# Altium project Main_Board.PrjPcb (part 1 of 44)
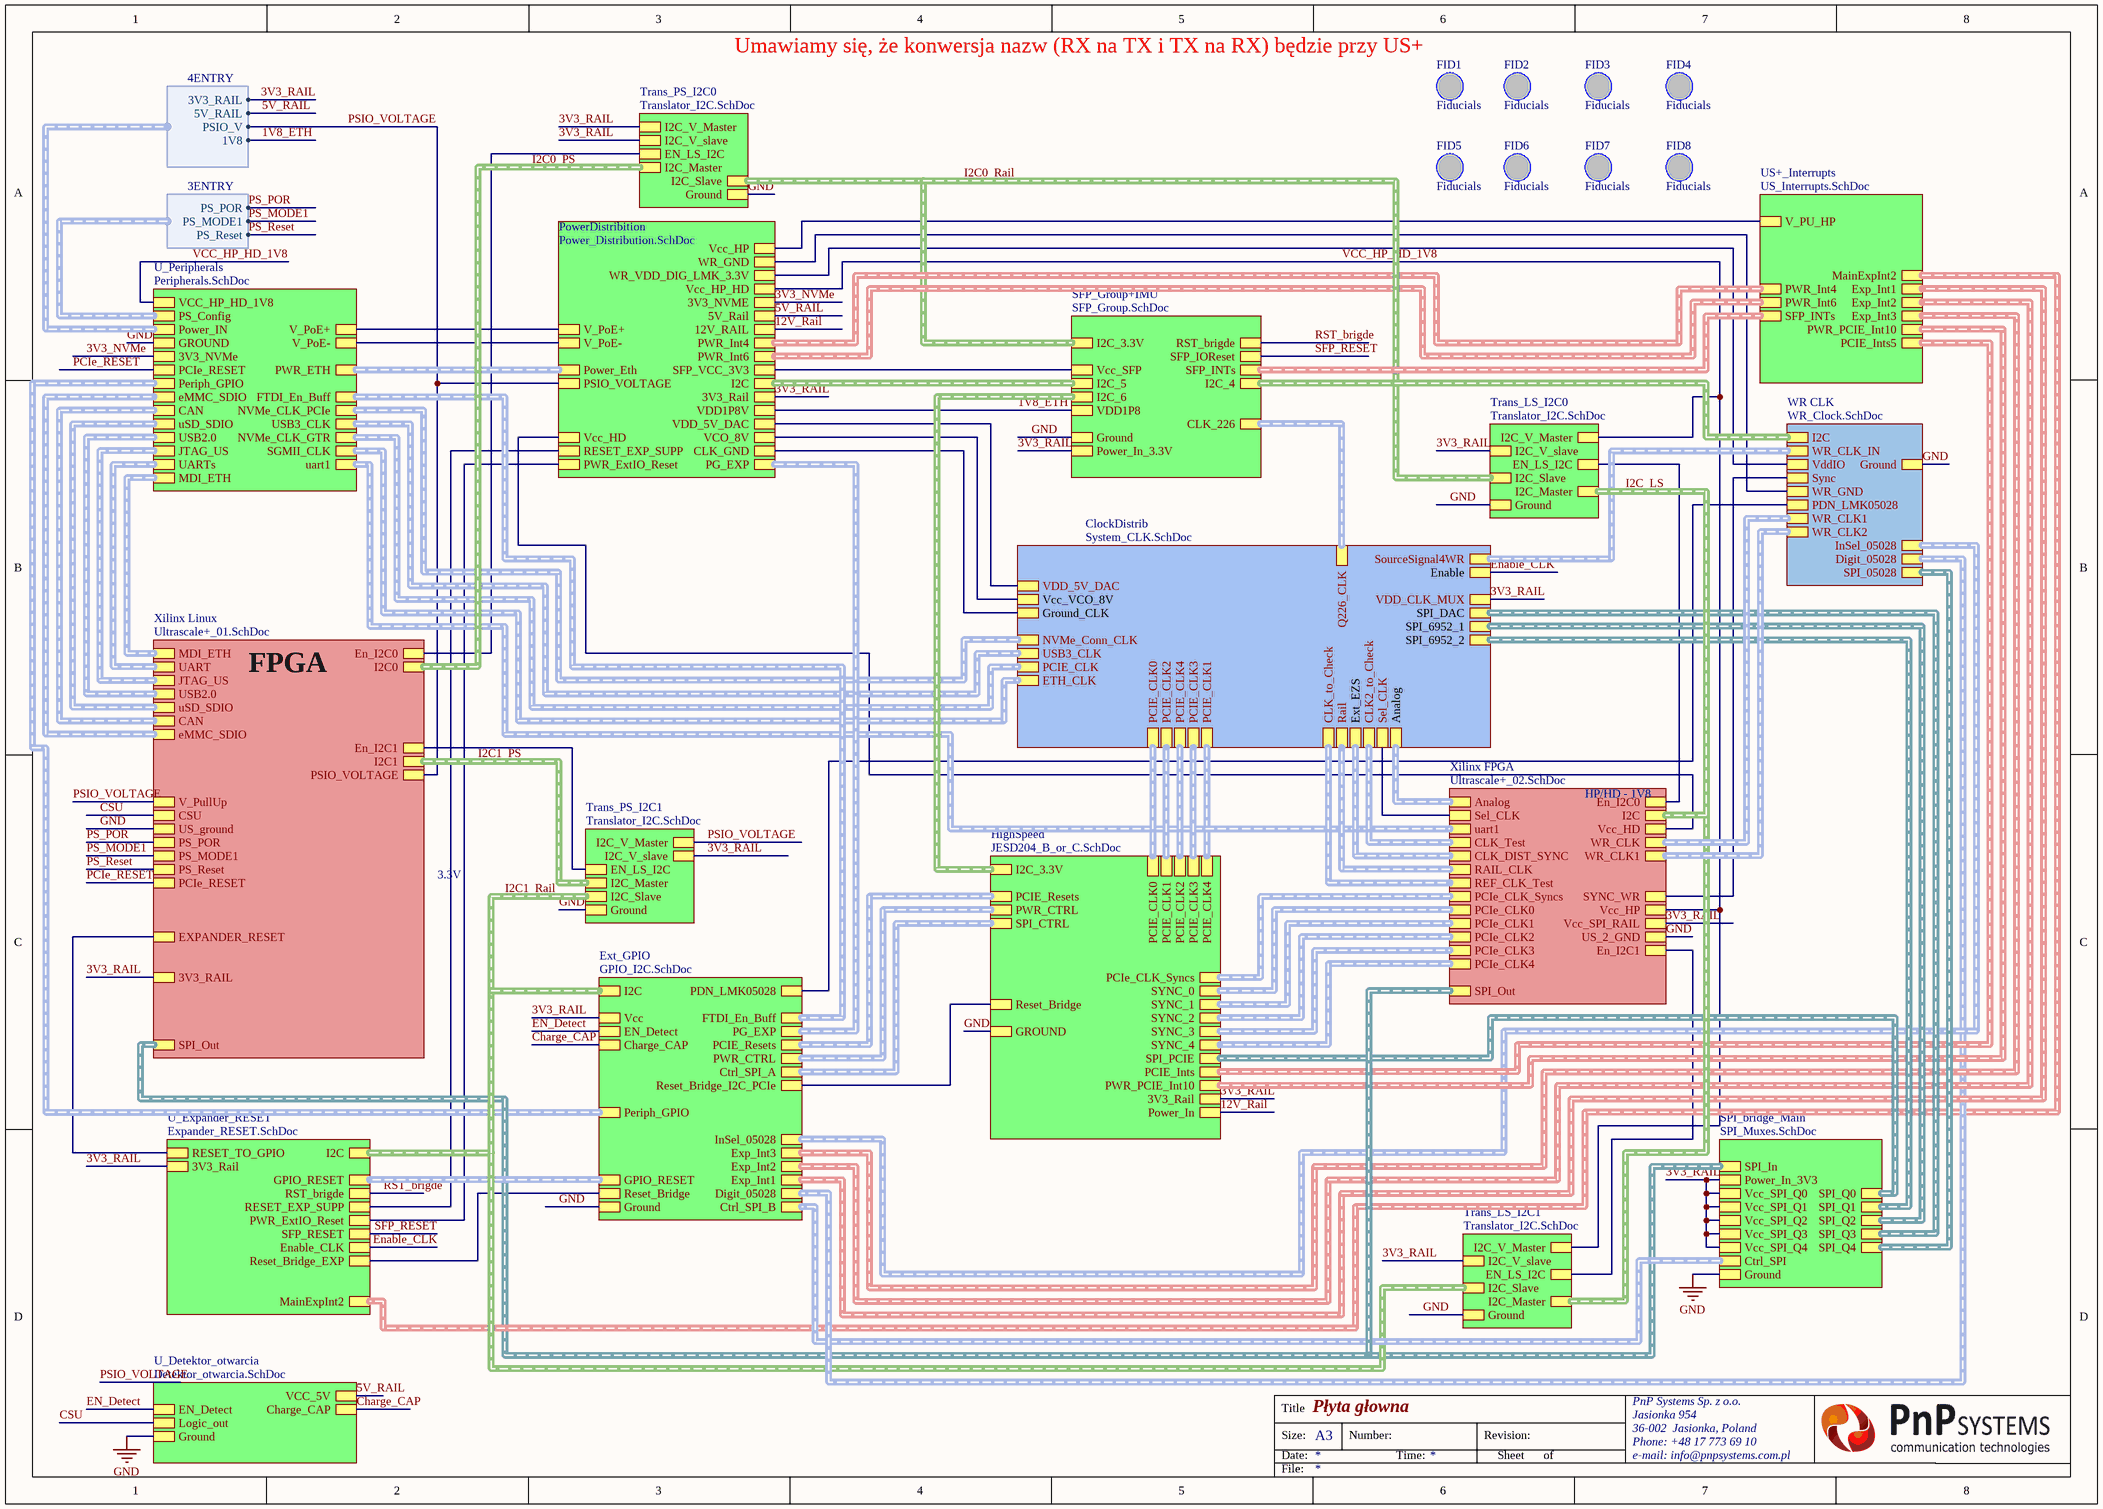
[diagram p0: Main_Board.SchDoc]
Address10: Jasionka 954; Address20: 36-002  Jasionka, Poland; Address30: Phone: +48 17 773 69 10; Address40: e-mail: info@pnpsystems.com.pl; CompanyName1: PnP Systems Sp. z o.o.
70 sheets, 2644 parts. Net scope: hierarchical (ports join the sheet entries above them; power ports are global).
Board file: MainBoardPCB.PcbDoc
Sheets:
  Main_Board.SchDoc
    Xilinx Linux = Ultrascale+_01.SchDoc
      PS_Config = PS_Config.SchDoc
      U_LED_US_1 = LED_US_1.SchDoc
    WR CLK = WR_Clock.SchDoc
    ClockDistrib = System_CLK.SchDoc
      DAC = DAC.SchDoc
      CLK_MUX = CLK_Mux.SchDoc
      LTC6952_1 = LTC6952_1.SchDoc
      LTC6952_0 = LTC6952.SchDoc
    Xilinx FPGA = Ultrascale+_02.SchDoc
    HighSpeed = JESD204_B_or_C.SchDoc
      PCIE0 = PCIe.SchDoc
      PCIE1 = PCIe.SchDoc
      PCIE2 = PCIe.SchDoc
      PCIE3 = PCIe.SchDoc
      PCIE4 = PCIe.SchDoc
      Bank 224 = Bank224.SchDoc
      Bank 225 = Bank225.SchDoc
      Bank 223 = Bank223.SchDoc
      I2C_Bridge_PCIE = I2C_Bridge.SchDoc
      SPI_bridge_PCIe = SPI_Muxes.SchDoc
      Power4HighSpeed = Power4HiSpeed.SchDoc
        U_Pomiar_pradu_napiecia_PCIe0 = Pomiar_pradu_napiecia.SchDoc
        U_Pomiar_pradu_napiecia_PCIe1 = Pomiar_pradu_napiecia.SchDoc
        U_Pomiar_pradu_napiecia_PCIe2 = Pomiar_pradu_napiecia.SchDoc
        U_Pomiar_pradu_napiecia_PCIe3 = Pomiar_pradu_napiecia.SchDoc
        U_Pomiar_pradu_napiecia_PCIe4 = Pomiar_pradu_napiecia.SchDoc
    PowerDistribition = Power_Distribution.SchDoc
      PowerSelector = Power_Switch.SchDoc
      HiCurrent = Power_Hi_Curr.SchDoc
        U_HI_Curr_ADP1850_1 = HI_Curr_ADP1850.SchDoc
        U_HI_Curr_ADP1850_3 = Power_ADP1850_Dual.SchDoc
        U_Power_ADP1850_Dual_2 = Power_ADP1850_Dual_1.SchDoc
        U_Pomiar_pradu_napiecia_3 = Pomiar_pradu_napiecia.SchDoc
        U_Pomiar_pradu_napiecia_4 = Pomiar_pradu_napiecia.SchDoc
        U_Pomiar_pradu_napiecia_5 = Pomiar_pradu_napiecia.SchDoc
        U_Pomiar_pradu_napiecia_6 = Pomiar_pradu_napiecia.SchDoc
        U_Pomiar_napiecia_high_curr = Pomiar_napiecia_high_curr.SchDoc
      LowCurr = Power_Low_Curr.SchDoc
      Zasilanie CLK = Zasilanie_CLKDistribution.SchDoc
        U_ADP1741_3 = ADP1741_3.6V_3.3V@2A.SchDoc
        5to3V3_1 = 5V_to_3V3.SchDoc
        5to3V3_2 = 5V_to_3V3.SchDoc
        U_LT3042_12V_5V_LNLDO = LT3042_12V_5V_LNLDO.SchDoc
        U_TPS7A88_5V_Dual_3 = TPS7A88_5V_Dual_3.3V_3.3V.SchDoc
        I2C_Expander_PWR_CLK = I2C_Expander.SchDoc
      Ram_Power = RAM_Power.SchDoc
      XilinxPower = XilinxPower.SchDoc
        U_FPGA_Decoupling = FPGA_Decoupling.SchDoc
      Ram = RAM.SchDoc
      GND = Ground.SchDoc
      U_Power_Ethernet = Power_Ethernet.SchDoc
      I2C_Expander_PWR_Dist = I2C_Expander.SchDoc
      U_Pomiar_pradu_napiecia_1 = Pomiar_pradu_napiecia.SchDoc
      U_Pomiar_pradu_napiecia_2 = Pomiar_pradu_napiecia.SchDoc
      U_Power_48_20V@3A = Power_48_20V@3A.SchDoc
      U_UM78M_12_8V = UM78M_12_8V.SchDoc
      U_TPS7A88_3V3_1V8_0V9V@2x1A = TPS7A88_3V3_1V8_0V9V@2x1A.SchDoc
      U_ADP1741_3V3_0V85 = ADP1741_3V3_0V85.SchDoc
      U_ST1L08_5V_0V6 = ST1L08_5V_0V6.SchDoc
      U_Power_LED = Power_LED.SchDoc
    Trans_LS_I2C0 = Translator_I2C.SchDoc
    Ext_GPIO = GPIO_I2C.SchDoc
      I2C_Bridge_GPIO = I2C_Bridge.SchDoc
      Ext_GPIO_Bank0 = Ext_GPIO_Bank0.SchDoc
        I2C_Expander_00 = I2C_Expander.SchDoc
        I2C_Expander_01 = I2C_Expander.SchDoc
        I2C_Expander_02 = I2C_Expander.SchDoc
      Ext_GPIO_Bank1 = Ext_GPIO_Bank1.SchDoc
        I2C_Expander_10 = I2C_Expander.SchDoc
        I2C_Expander_11 = I2C_Expander.SchDoc
        I2C_Expander_12 = I2C_Expander.SchDoc
      Ext_GPIO_Bank2 = Ext_GPIO_Bank2.SchDoc
    SFP_Group+IMU = SFP_Group.SchDoc
      SFP0 = SFP.SchDoc
      SFP1 = SFP1.SchDoc
      SFP2 = SFP2.SchDoc
      SFP3 = SFP3.SchDoc
      I2C_Bridge_SFP = I2C_Bridge.SchDoc
      Bank 226 = bank226.SchDoc
      IMU = IMU.SchDoc
      I2C_Expander_SFP = I2C_Expander.SchDoc
    Trans_PS_I2C0 = Translator_I2C.SchDoc
    Trans_PS_I2C1 = Translator_I2C.SchDoc
    SPI_bridge_Main = SPI_Muxes.SchDoc
    Trans_LS_I2C1 = Translator_I2C.SchDoc
    U_Detektor_otwarcia = Detektor_otwarcia.SchDoc
    U_Peripherals = Peripherals.SchDoc
      Gigabit Eth = RJ45.SchDoc
      NVMe = Sata.SchDoc
      µSD = uSD.SchDoc
      Debug = FTDI.SchDoc
        5V_to_3V3_for_FTDI = 5V_to_3V3.SchDoc
      USB3.0 = USB3.SchDoc
      U_CAN = CAN.SchDoc
      Flash_Memory = eMMC.SchDoc
      GTR = GTR.SchDoc
    U_Expander_RESET = Expander_RESET.SchDoc
      I2C_Expander_Main_Rst = I2C_Expander.SchDoc
    US+_Interrupts = US_Interrupts.SchDoc

## Sheet Main_Board.SchDoc: Płyta głowna
size A3; Organization: Altium Limited; Address1: L3, 12a Rodborough Rd; Address2: Frenchs Forest; Address3: NSW; Address4: Australia 2086

### Parts
FID1  Fiducials  [Fiducials]
FID2  Fiducials  [Fiducials]
FID3  Fiducials  [Fiducials]
FID4  Fiducials  [Fiducials]
FID5  Fiducials  [Fiducials]
FID6  Fiducials  [Fiducials]
FID7  Fiducials  [Fiducials]
FID8  Fiducials  [Fiducials]

### Sub-sheets
ClockDistrib = System_CLK.SchDoc: SPI_6952_1 (harness SPI_H), Ground_CLK, Ext_EZS (harness Diff_1Pair), Enable, Analog (harness Analog), Vcc_VCO_8V, SPI_6952_2 (harness SPI_H), SPI_DAC (harness SPI_H), Q226_CLK (harness Diff_1Pair), SourceSignal4WR (harness Diff_1Pair), Rail (harness Diff_1Pair), CLK_to_Check (harness Diff_1Pair), ETH_CLK (harness Diff_1Pair), USB3_CLK (harness Diff_1Pair), PCIE_CLK (harness Diff_1Pair), Sel_CLK, CLK2_to_Check (harness Diff_1Pair), NVMe_Conn_CLK (harness Diff_1Pair), VDD_5V_DAC, VDD_CLK_MUX, PCIE_CLK0 (harness Diff_1Pair), PCIE_CLK2 (harness Diff_1Pair), PCIE_CLK4 (harness Diff_1Pair), PCIE_CLK3 (harness Diff_1Pair), PCIE_CLK1 (harness Diff_1Pair)
Ext_GPIO = GPIO_I2C.SchDoc: Ctrl_SPI_B (harness Ctrl_SPI_PCIE), Ctrl_SPI_A (harness Ctrl_SPI_PCIE), Ground, Vcc, I2C (harness I2C), Digit_05028 (harness 05028_Digit), GPIO_RESET (harness Exp_Reset3), Reset_Bridge, PG_EXP (harness 7_PG), PDN_LMK05028, EN_Detect, Charge_CAP, Exp_Int1 (harness Exp_Int), PCIE_Resets (harness PCIe_Resets), PWR_CTRL (harness Ctrl_Pwr4HiSpeed), Periph_GPIO (harness Periph_GPIO), Exp_Int2 (harness Exp_Int), Exp_Int3 (harness Exp_Int), InSel_05028 (harness InSel_05028), FTDI_En_Buff (harness FTDI_En_Buff), Reset_Bridge_I2C_PCIe
HighSpeed = JESD204_B_or_C.SchDoc: PCIE_Resets (harness PCIe_Resets), SPI_PCIE (harness SPI_H), Power_In, SPI_CTRL (harness Ctrl_SPI_PCIE), PWR_CTRL (harness Ctrl_Pwr4HiSpeed), I2C_3.3V (harness I2C), Reset_Bridge, 3V3_Rail, PWR_PCIE_Int10 (harness PWR_PCIE_Int10), GROUND, PCIE_Ints (harness PCIe_Ints), PCIe_CLK_Syncs (harness PCIe_CLK_Syncs), SYNC_4 (harness Diff_3Diff_Pcie), SYNC_3 (harness Diff_3Diff_Pcie), SYNC_2 (harness Diff_3Diff_Pcie), SYNC_1 (harness Diff_3Diff_Pcie), SYNC_0 (harness Diff_3Diff_Pcie), PCIE_CLK4 (harness Diff_1Pair), PCIE_CLK0 (harness Diff_1Pair), PCIE_CLK3 (harness Diff_1Pair), PCIE_CLK1 (harness Diff_1Pair), PCIE_CLK2 (harness Diff_1Pair)
PowerDistribition = Power_Distribution.SchDoc: Power_Eth (harness Power_ETH), V_PoE-, V_PoE+, SFP_VCC_3V3, 3V3_Rail, I2C (harness I2C), VDD1P8V, 12V_RAIL, PWR_Int4 (harness PWR_Int4), PWR_ExtIO_Reset, 5V_Rail, PWR_Int6 (harness PWR_Interrupt), WR_VDD_DIG_LMK_3.3V, PSIO_VOLTAGE, VCO_8V, 3V3_NVME, VDD_5V_DAC, Vcc_HP_HD, WR_GND, CLK_GND, RESET_EXP_SUPP, PG_EXP (harness 7_PG), Vcc_HP, Vcc_HD
SFP_Group+IMU = SFP_Group.SchDoc: I2C_3.3V (harness I2C), RST_brigde, Ground, Vcc_SFP, SFP_INTs (harness SFP_INTs), I2C_5 (harness I2C), Power_In_3.3V, VDD1P8, SFP_IOReset, CLK_226 (harness Diff_1Pair), I2C_6 (harness I2C), I2C_4 (harness I2C)
SPI_bridge_Main = SPI_Muxes.SchDoc: SPI_Q0 (harness SPI_H), SPI_Q1 (harness SPI_H), SPI_Q2 (harness SPI_H), SPI_Q3 (harness SPI_H), SPI_Q4 (harness SPI_H), SPI_In (harness SPI_H), Power_In_3V3, Ctrl_SPI (harness Ctrl_SPI_PCIE), Vcc_SPI_Q4, Vcc_SPI_Q3, Vcc_SPI_Q2, Vcc_SPI_Q1, Vcc_SPI_Q0, Ground
Trans_LS_I2C0 = Translator_I2C.SchDoc: Ground, EN_LS_I2C, I2C_Slave (harness I2C), I2C_Master (harness I2C), I2C_V_slave, I2C_V_Master
Trans_LS_I2C1 = Translator_I2C.SchDoc: Ground, EN_LS_I2C, I2C_Slave (harness I2C), I2C_Master (harness I2C), I2C_V_slave, I2C_V_Master
Trans_PS_I2C0 = Translator_I2C.SchDoc: Ground, EN_LS_I2C, I2C_Slave (harness I2C), I2C_Master (harness I2C), I2C_V_slave, I2C_V_Master
Trans_PS_I2C1 = Translator_I2C.SchDoc: Ground, EN_LS_I2C, I2C_Slave (harness I2C), I2C_Master (harness I2C), I2C_V_slave, I2C_V_Master
U_Detektor_otwarcia = Detektor_otwarcia.SchDoc: EN_Detect, Logic_out, Ground, VCC_5V, Charge_CAP
U_Expander_RESET = Expander_RESET.SchDoc: 3V3_Rail, RESET_TO_GPIO, GPIO_RESET (harness Exp_Reset3), RESET_EXP_SUPP, PWR_ExtIO_Reset, SFP_RESET, MainExpInt2 (harness MainExpInt2), RST_brigde, Enable_CLK, Reset_Bridge_EXP, I2C (harness I2C)
U_Peripherals = Peripherals.SchDoc: 3V3_NVMe, GROUND, V_PoE+, V_PoE-, PS_Config (harness 3ENTRY), Periph_GPIO (harness Periph_GPIO), Power_IN (harness 4ENTRY), PWR_ETH (harness Power_ETH), uart1 (harness uart), UARTs (harness 2Uarts), USB2.0 (harness USB_H), MDI_ETH (harness MDI_ETH), CAN (harness CAN), uSD_SDIO (harness SDIO_H), eMMC_SDIO (harness SDIO_H), NVMe_CLK_GTR (harness Diff_1Pair), USB3_CLK (harness Diff_1Pair), SGMII_CLK (harness Diff_1Pair), JTAG_US (harness JTAG), NVMe_CLK_PCIe (harness Diff_1Pair), VCC_HP_HD_1V8, FTDI_En_Buff (harness FTDI_En_Buff), PCIe_RESET
US+_Interrupts = US_Interrupts.SchDoc: V_PU_HP, MainExpInt2 (harness MainExpInt2), PCIE_Ints5 (harness PCIe_Ints5), PWR_Int4 (harness PWR_Int4), PWR_Int6 (harness PWR_Interrupt), SFP_INTs (harness SFP_INTs), Exp_Int1 (harness Exp_Int), PWR_PCIE_Int10 (harness PWR_PCIE_Int10), Exp_Int2 (harness Exp_Int), Exp_Int3 (harness Exp_Int)
WR CLK = WR_Clock.SchDoc: WR_CLK1 (harness Diff_1Pair), WR_CLK2 (harness Diff_1Pair), Sync, VddIO, WR_CLK_IN (harness Diff_1Pair), SPI_05028 (harness SPI_H), Ground, Digit_05028 (harness 05028_Digit), I2C (harness I2C), WR_GND, PDN_LMK05028, InSel_05028 (harness InSel_05028)
Xilinx FPGA = Ultrascale+_02.SchDoc: I2C (harness I2C), SPI_Out (harness SPI_H), uart1 (harness uart), En_I2C0, WR_CLK (harness Diff_1Pair), REF_CLK_Test (harness Diff_1Pair), RAIL_CLK (harness Diff_1Pair), Analog (harness Analog), CLK_DIST_SYNC (harness Diff_1Pair), WR_CLK1 (harness Diff_1Pair), Vcc_HP, US_2_GND, Vcc_SPI_RAIL, En_I2C1, Sel_CLK, SYNC_WR, CLK_Test (harness Diff_1Pair), PCIe_CLK_Syncs (harness PCIe_CLK_Syncs), Vcc_HD, PCIe_CLK2 (harness Diff_3Diff_Pcie), PCIe_CLK4 (harness Diff_3Diff_Pcie), PCIe_CLK1 (harness Diff_3Diff_Pcie), PCIe_CLK3 (harness Diff_3Diff_Pcie), PCIe_CLK0 (harness Diff_3Diff_Pcie)
Xilinx Linux = Ultrascale+_01.SchDoc: I2C0 (harness I2C), SPI_Out (harness SPI_H), I2C1 (harness I2C), En_I2C0, En_I2C1, V_PullUp, US_ground, CSU, PSIO_VOLTAGE, PS_POR, PS_MODE1, PS_Reset, UART (harness 2Uarts), EXPANDER_RESET, MDI_ETH (harness MDI_ETH), USB2.0 (harness USB_H), eMMC_SDIO (harness SDIO_H), CAN (harness CAN), uSD_SDIO (harness SDIO_H), JTAG_US (harness JTAG), PCIe_RESET, 3V3_RAIL  | Parameter 1: FPGA

### Harnesses
4ENTRY: 3V3_RAIL, 5V_RAIL, PSIO_V, 1V8
3ENTRY: PS_POR, PS_MODE1, PS_Reset

### Nets
GND: sheet Xilinx Linux/US_ground, sheet WR CLK/Ground, sheet Xilinx FPGA/US_2_GND, sheet HighSpeed/GROUND, sheet Trans_LS_I2C0/Ground, sheet Ext_GPIO/Ground, sheet SFP_Group+IMU/Ground, sheet Trans_PS_I2C0/Ground, sheet Trans_PS_I2C1/Ground, sheet SPI_bridge_Main/Ground, sheet Trans_LS_I2C1/Ground, sheet U_Detektor_otwarcia/Ground, sheet U_Peripherals/GROUND  [project net B503_Ground]
1V8_ETH: sheet PowerDistribition/VDD1P8V, sheet SFP_Group+IMU/VDD1P8, sheet U_Peripherals/Power_IN.1V8  [project net 1V8@1.5A]
3V3_NVMe: sheet PowerDistribition/3V3_NVME, sheet U_Peripherals/3V3_NVMe
3V3_RAIL: sheet Xilinx Linux/3V3_RAIL, sheet ClockDistrib/VDD_CLK_MUX, sheet Xilinx FPGA/Vcc_SPI_RAIL, sheet HighSpeed/3V3_Rail, sheet PowerDistribition/SFP_VCC_3V3, sheet PowerDistribition/3V3_Rail, sheet Trans_LS_I2C0/I2C_V_slave, sheet Ext_GPIO/Vcc, sheet SFP_Group+IMU/Vcc_SFP, sheet SFP_Group+IMU/Power_In_3.3V, sheet Trans_PS_I2C0/I2C_V_slave, sheet Trans_PS_I2C0/I2C_V_Master, sheet Trans_PS_I2C1/I2C_V_slave, sheet SPI_bridge_Main/Power_In_3V3, sheet SPI_bridge_Main/Vcc_SPI_Q4, sheet SPI_bridge_Main/Vcc_SPI_Q3, sheet SPI_bridge_Main/Vcc_SPI_Q2, sheet SPI_bridge_Main/Vcc_SPI_Q1, sheet SPI_bridge_Main/Vcc_SPI_Q0, sheet Trans_LS_I2C1/I2C_V_slave, sheet U_Expander_RESET/3V3_Rail, sheet U_Peripherals/Power_IN.3V3_RAIL
5V_LN: sheet ClockDistrib/VDD_5V_DAC, sheet PowerDistribition/VDD_5V_DAC
5V_RAIL: sheet PowerDistribition/5V_Rail, sheet U_Detektor_otwarcia/VCC_5V, sheet U_Peripherals/Power_IN.5V_RAIL
12V_Rail: sheet HighSpeed/Power_In, sheet PowerDistribition/12V_RAIL  [project net 12V_LT3042]
AGND: sheet ClockDistrib/Ground_CLK, sheet PowerDistribition/CLK_GND
Charge_CAP: sheet Ext_GPIO/Charge_CAP, sheet U_Detektor_otwarcia/Charge_CAP
CSU: sheet Xilinx Linux/CSU, sheet U_Detektor_otwarcia/Logic_out
D_05028_G0: sheet WR CLK/Sync, sheet Xilinx FPGA/SYNC_WR
EN_Detect: sheet Ext_GPIO/EN_Detect, sheet U_Detektor_otwarcia/EN_Detect
Enable_CLK: sheet ClockDistrib/Enable, sheet U_Expander_RESET/Enable_CLK
EXPANDER_RESET: sheet Xilinx Linux/EXPANDER_RESET, sheet U_Expander_RESET/RESET_TO_GPIO
GPIOa_11.GPIO7: sheet WR CLK/PDN_LMK05028, sheet Ext_GPIO/PDN_LMK05028
GPIOb_02.GPIO0: sheet HighSpeed/Reset_Bridge, sheet Ext_GPIO/Reset_Bridge_I2C_PCIe
Ground: sheet WR CLK/WR_GND, sheet PowerDistribition/WR_GND
MIO_GPIO_2_74: sheet Xilinx Linux/En_I2C1, sheet Trans_PS_I2C1/EN_LS_I2C
MIO_GPIO_2_75: sheet Xilinx Linux/En_I2C0, sheet Trans_PS_I2C0/EN_LS_I2C
PCIe_RESET: sheet Xilinx Linux/PCIe_RESET, sheet U_Peripherals/PCIe_RESET
PGND: sheet PowerDistribition/V_PoE-, sheet U_Peripherals/V_PoE-
PS_MODE1: sheet Xilinx Linux/PS_MODE1, sheet U_Peripherals/PS_Config.PS_MODE1
PS_POR: sheet Xilinx Linux/PS_POR, sheet U_Peripherals/PS_Config.PS_POR
PS_Reset: sheet Xilinx Linux/PS_Reset, sheet U_Peripherals/PS_Config.PS_Reset
PSIO_VOLTAGE: sheet Xilinx Linux/V_PullUp, sheet Xilinx Linux/PSIO_VOLTAGE, sheet PowerDistribition/PSIO_VOLTAGE, sheet Trans_PS_I2C1/I2C_V_Master, sheet U_Peripherals/Power_IN.PSIO_V  [project net ETH_VDDIO]
PWR_ExtIO_nReset: sheet PowerDistribition/PWR_ExtIO_Reset, sheet U_Expander_RESET/PWR_ExtIO_Reset
RST_brigde: sheet SFP_Group+IMU/RST_brigde, sheet U_Expander_RESET/RST_brigde
SetClk_Si53323_2: sheet ClockDistrib/Sel_CLK, sheet Xilinx FPGA/Sel_CLK
SFP_RESET: sheet SFP_Group+IMU/SFP_IOReset, sheet U_Expander_RESET/SFP_RESET  [project net SFP_IO_nReset]
V_PoE+: sheet PowerDistribition/V_PoE+, sheet U_Peripherals/V_PoE+
VCC_HP_HD_1V8: sheet Xilinx FPGA/Vcc_HP, sheet Xilinx FPGA/Vcc_HD, sheet PowerDistribition/Vcc_HP_HD, sheet PowerDistribition/Vcc_HP, sheet PowerDistribition/Vcc_HD, sheet Trans_LS_I2C0/I2C_V_Master, sheet Trans_LS_I2C1/I2C_V_Master, sheet U_Peripherals/VCC_HP_HD_1V8, sheet US+_Interrupts/V_PU_HP  [project net US+_MGTVccAux]
VDD_DIG: sheet WR CLK/VddIO, sheet PowerDistribition/WR_VDD_DIG_LMK_3.3V
NetC713_2: sheet ClockDistrib/Vcc_VCO_8V, sheet PowerDistribition/VCO_8V
NetR754_1: sheet PowerDistribition/RESET_EXP_SUPP, sheet U_Expander_RESET/RESET_EXP_SUPP
NetR918_2: sheet Xilinx FPGA/En_I2C0, sheet Trans_LS_I2C0/EN_LS_I2C
NetR919_2: sheet Xilinx FPGA/En_I2C1, sheet Trans_LS_I2C1/EN_LS_I2C
NetSP12_I2C_Bridge_GPIO_1: sheet Ext_GPIO/Reset_Bridge, sheet U_Expander_RESET/Reset_Bridge_EXP

### Buses and harness runs
harness I2C0_PS = sheet Trans_PS_I2C0/I2C_Master = sheet Xilinx Linux/I2C0
harness I2C0_Rail = sheet SFP_Group+IMU/I2C_3.3V = sheet Trans_LS_I2C0/I2C_Slave = sheet Trans_PS_I2C0/I2C_Slave
harness I2C1_PS = sheet Trans_PS_I2C1/I2C_Master = sheet Xilinx Linux/I2C1
harness I2C1_Rail = sheet Ext_GPIO/I2C = sheet Trans_LS_I2C1/I2C_Slave = sheet Trans_PS_I2C1/I2C_Slave = sheet U_Expander_RESET/I2C
harness I2C_LS = sheet Trans_LS_I2C0/I2C_Master = sheet Trans_LS_I2C1/I2C_Master = sheet Xilinx FPGA/I2C
harness sheet ClockDistrib/Analog = sheet Xilinx FPGA/Analog
harness sheet ClockDistrib/CLK2_to_Check = sheet Xilinx FPGA/CLK_Test
harness sheet ClockDistrib/CLK_to_Check = sheet Xilinx FPGA/REF_CLK_Test
harness sheet ClockDistrib/ETH_CLK = sheet U_Peripherals/SGMII_CLK
harness sheet ClockDistrib/Ext_EZS = sheet Xilinx FPGA/CLK_DIST_SYNC
harness sheet ClockDistrib/NVMe_Conn_CLK = sheet U_Peripherals/NVMe_CLK_PCIe
harness sheet ClockDistrib/PCIE_CLK0 = sheet HighSpeed/PCIE_CLK0
harness sheet ClockDistrib/PCIE_CLK1 = sheet HighSpeed/PCIE_CLK4
harness sheet ClockDistrib/PCIE_CLK2 = sheet HighSpeed/PCIE_CLK1
harness sheet ClockDistrib/PCIE_CLK3 = sheet HighSpeed/PCIE_CLK3
harness sheet ClockDistrib/PCIE_CLK4 = sheet HighSpeed/PCIE_CLK2
harness sheet ClockDistrib/PCIE_CLK = sheet U_Peripherals/NVMe_CLK_GTR
harness sheet ClockDistrib/Q226_CLK = sheet SFP_Group+IMU/CLK_226
harness sheet ClockDistrib/Rail = sheet Xilinx FPGA/RAIL_CLK
harness sheet ClockDistrib/SourceSignal4WR = sheet WR CLK/WR_CLK_IN
harness sheet ClockDistrib/SPI_6952_1 = sheet SPI_bridge_Main/SPI_Q2
harness sheet ClockDistrib/SPI_6952_2 = sheet SPI_bridge_Main/SPI_Q1
harness sheet ClockDistrib/SPI_DAC = sheet SPI_bridge_Main/SPI_Q3
harness sheet ClockDistrib/USB3_CLK = sheet U_Peripherals/USB3_CLK
harness sheet Ext_GPIO/Ctrl_SPI_A = sheet HighSpeed/SPI_CTRL
harness sheet Ext_GPIO/Ctrl_SPI_B = sheet SPI_bridge_Main/Ctrl_SPI
harness sheet Ext_GPIO/Digit_05028 = sheet WR CLK/Digit_05028
harness sheet Ext_GPIO/Exp_Int1 = sheet US+_Interrupts/Exp_Int1
harness sheet Ext_GPIO/Exp_Int2 = sheet US+_Interrupts/Exp_Int2
harness sheet Ext_GPIO/Exp_Int3 = sheet US+_Interrupts/Exp_Int3
harness sheet Ext_GPIO/FTDI_En_Buff = sheet U_Peripherals/FTDI_En_Buff
harness sheet Ext_GPIO/GPIO_RESET = sheet U_Expander_RESET/GPIO_RESET
harness sheet Ext_GPIO/InSel_05028 = sheet WR CLK/InSel_05028
harness sheet Ext_GPIO/PCIE_Resets = sheet HighSpeed/PCIE_Resets
harness sheet Ext_GPIO/Periph_GPIO = sheet U_Peripherals/Periph_GPIO
harness sheet Ext_GPIO/PG_EXP = sheet PowerDistribition/PG_EXP
harness sheet Ext_GPIO/PWR_CTRL = sheet HighSpeed/PWR_CTRL
harness sheet HighSpeed/I2C_3.3V = sheet SFP_Group+IMU/I2C_6
harness sheet HighSpeed/PCIe_CLK_Syncs = sheet Xilinx FPGA/PCIe_CLK_Syncs
harness sheet HighSpeed/PCIE_Ints = sheet US+_Interrupts/PCIE_Ints5
harness sheet HighSpeed/PWR_PCIE_Int10 = sheet US+_Interrupts/PWR_PCIE_Int10
harness sheet HighSpeed/SPI_PCIE = sheet SPI_bridge_Main/SPI_Q0
harness sheet HighSpeed/SYNC_0 = sheet Xilinx FPGA/PCIe_CLK0
harness sheet HighSpeed/SYNC_1 = sheet Xilinx FPGA/PCIe_CLK1
harness sheet HighSpeed/SYNC_2 = sheet Xilinx FPGA/PCIe_CLK2
harness sheet HighSpeed/SYNC_3 = sheet Xilinx FPGA/PCIe_CLK3
harness sheet HighSpeed/SYNC_4 = sheet Xilinx FPGA/PCIe_CLK4
harness sheet PowerDistribition/I2C = sheet SFP_Group+IMU/I2C_5
harness sheet PowerDistribition/Power_Eth = sheet U_Peripherals/PWR_ETH
harness sheet PowerDistribition/PWR_Int4 = sheet US+_Interrupts/PWR_Int4
harness sheet PowerDistribition/PWR_Int6 = sheet US+_Interrupts/PWR_Int6
harness sheet SFP_Group+IMU/I2C_4 = sheet WR CLK/I2C
harness sheet SFP_Group+IMU/SFP_INTs = sheet US+_Interrupts/SFP_INTs
harness sheet SPI_bridge_Main/SPI_In = sheet Xilinx FPGA/SPI_Out = sheet Xilinx Linux/SPI_Out
harness sheet SPI_bridge_Main/SPI_Q4 = sheet WR CLK/SPI_05028
harness sheet U_Expander_RESET/MainExpInt2 = sheet US+_Interrupts/MainExpInt2
harness sheet U_Peripherals/CAN = sheet Xilinx Linux/CAN
harness sheet U_Peripherals/eMMC_SDIO = sheet Xilinx Linux/eMMC_SDIO
harness sheet U_Peripherals/JTAG_US = sheet Xilinx Linux/JTAG_US
harness sheet U_Peripherals/MDI_ETH = sheet Xilinx Linux/MDI_ETH
harness sheet U_Peripherals/uart1 = sheet Xilinx FPGA/uart1
harness sheet U_Peripherals/UARTs = sheet Xilinx Linux/UART
harness sheet U_Peripherals/USB2.0 = sheet Xilinx Linux/USB2.0
harness sheet U_Peripherals/uSD_SDIO = sheet Xilinx Linux/uSD_SDIO
harness sheet WR CLK/WR_CLK1 = sheet Xilinx FPGA/WR_CLK
harness sheet WR CLK/WR_CLK2 = sheet Xilinx FPGA/WR_CLK1

### Notes on the sheet
- Umawiamy się, że konwersja nazw (RX na TX i TX na RX) będzie przy US+
- HP/HD - 1V8
- 3.3V
- Title
- Size:
- Date:
- A3
- Number:
- Time:
- Revision:
- Sheet
- of
- File:

### Library data of the parts
FID1-FID8 = Fid